# Altium schematic sheet Teensy_4.1_Section(B).SchDoc
size 420 x 297 mm; SheetNumber: 4; SheetTotal: 5
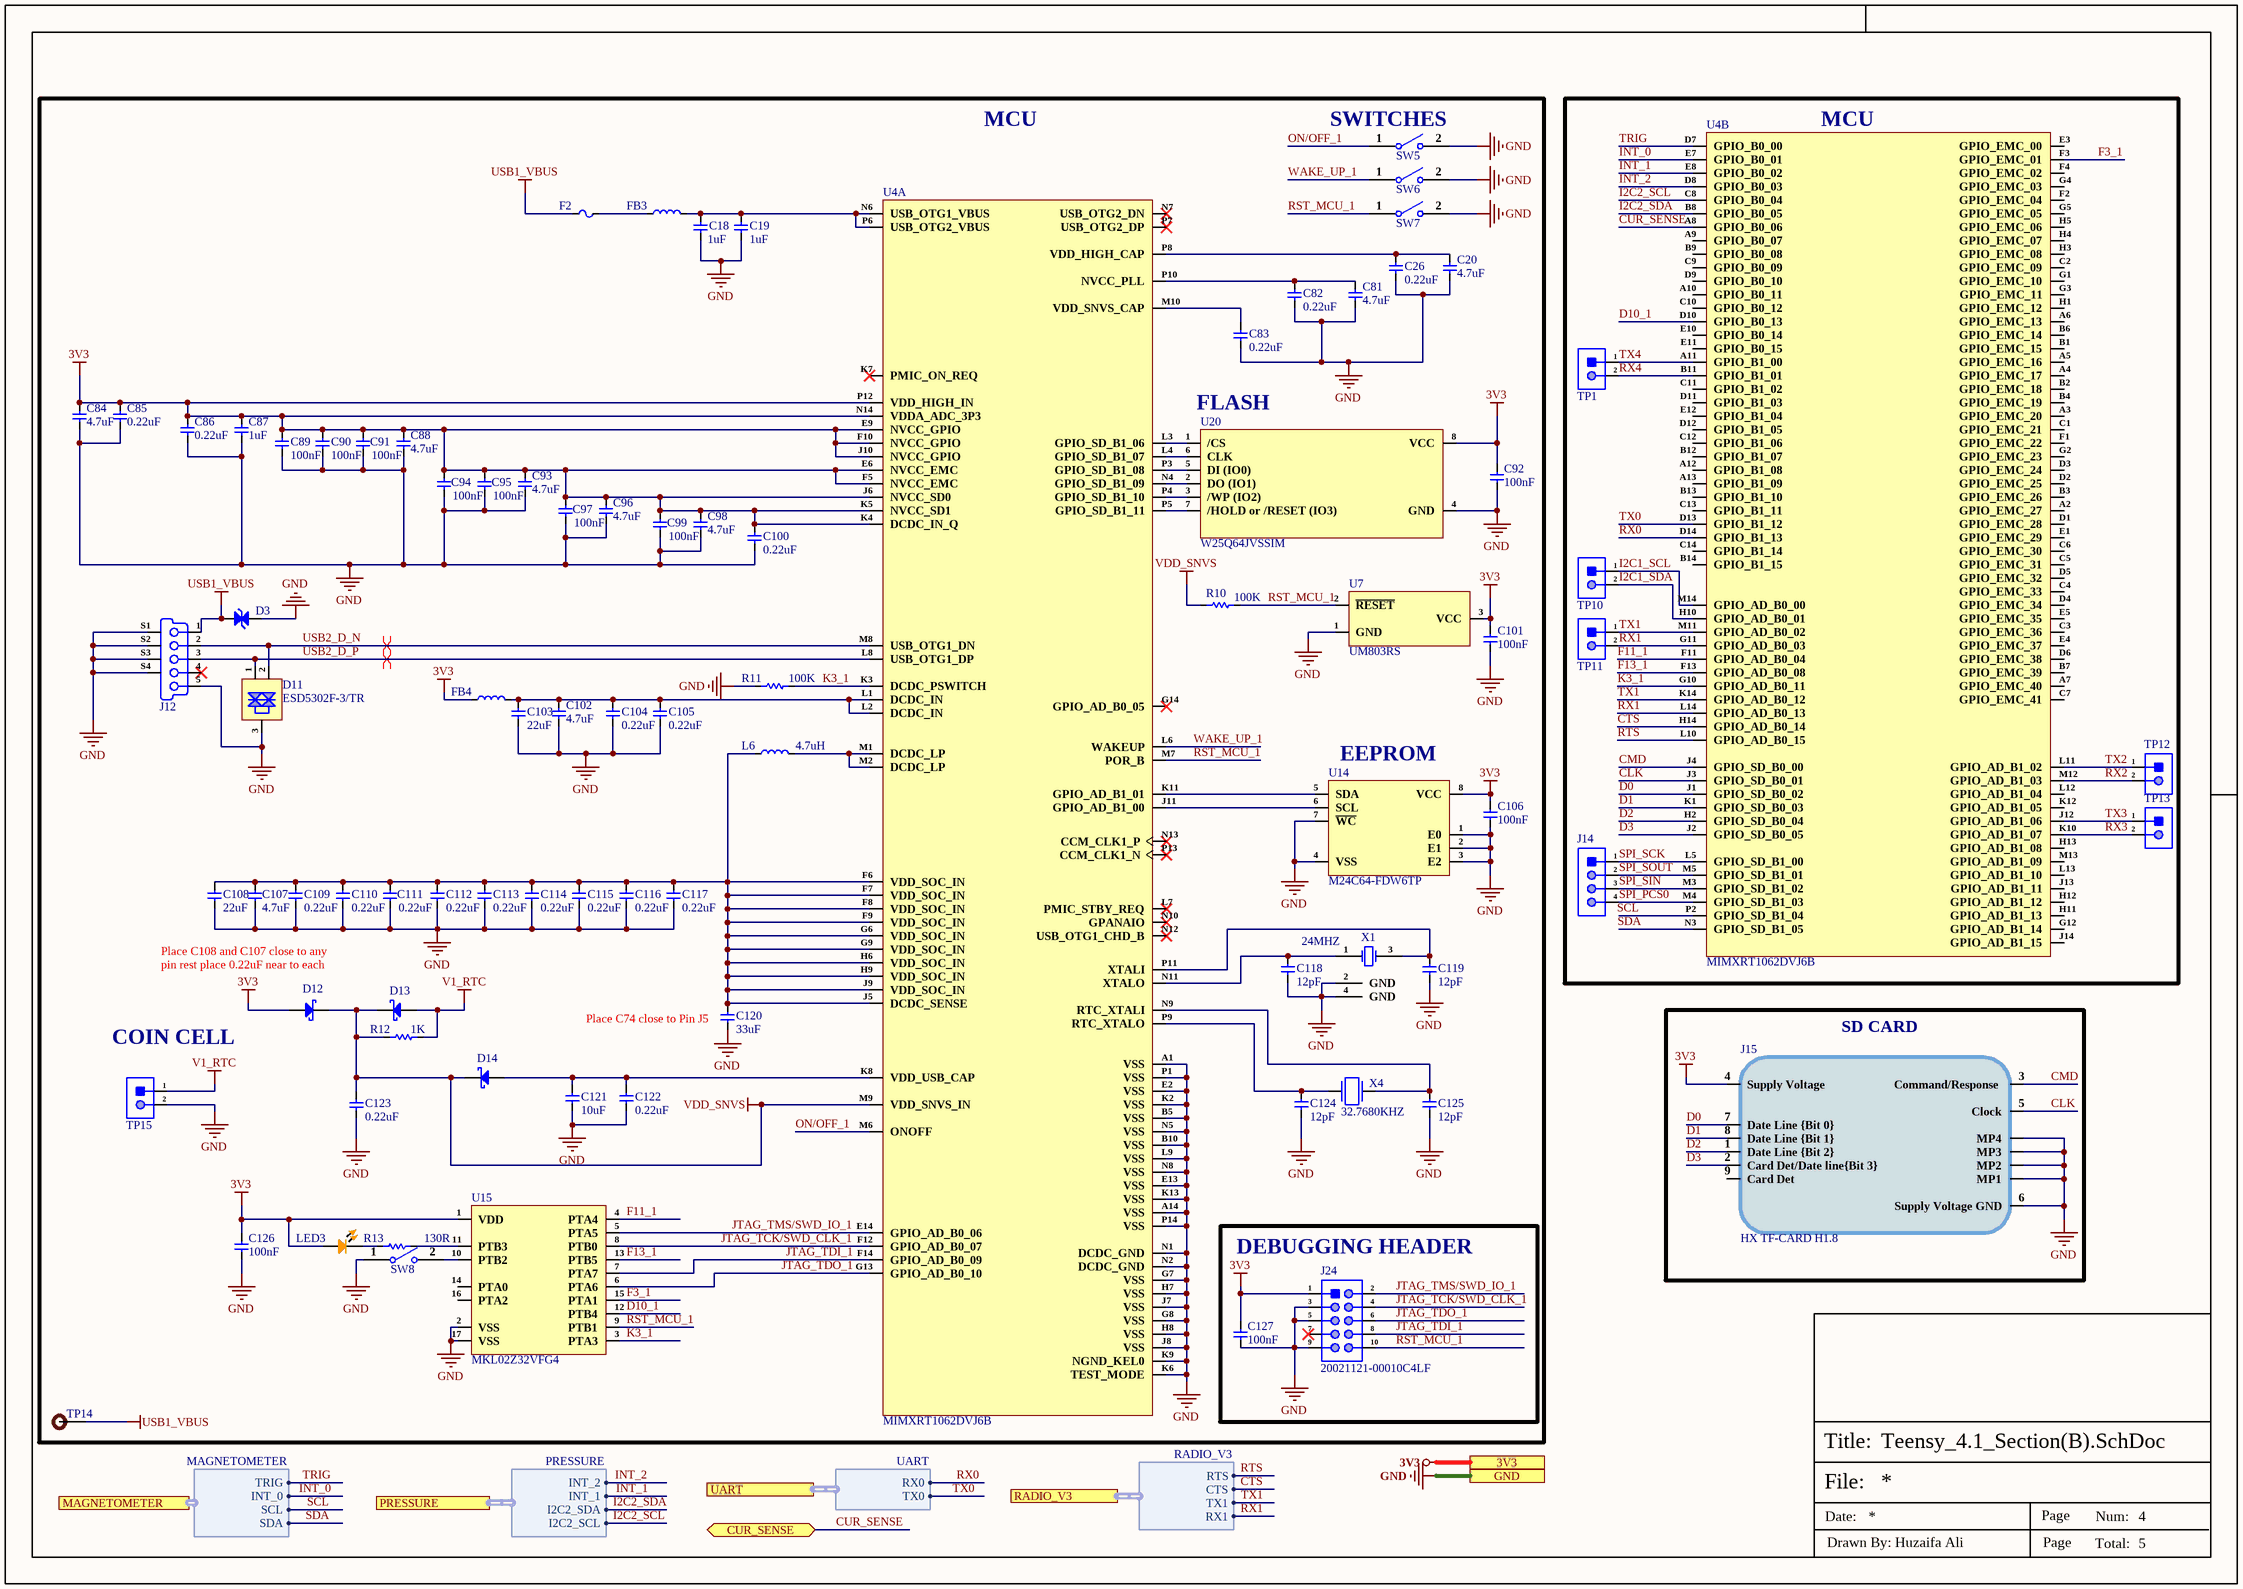
[diagram p0: Teensy_4.1_Section(B).SchDoc]

## Parts
C18  1uF  [Cap-0402]
C19  1uF  [Cap-0402]
C20  4.7uF  [Cap-0402]
C26  0.22uF  [Cap-0402]
C81  4.7uF  [Cap-0402]
C82  0.22uF  [Cap-0402]
C83  0.22uF  [Cap-0402]
C84  4.7uF  [Cap-0402]
C85  0.22uF  [Cap-0402]
C86  0.22uF  [Cap-0402]
C87  1uF  [Cap-0402]
C88  4.7uF  [Cap-0402]
C89  100nF  [cap-0402]
C90  100nF  [cap-0402]
C91  100nF  [cap-0402]
C92  100nF  [cap-0402]
C93  4.7uF  [Cap-0402]
C94  100nF  [cap-0402]
C95  100nF  [cap-0402]
C96  4.7uF  [Cap-0402]
C97  100nF  [cap-0402]
C98  4.7uF  [Cap-0402]
C99  100nF  [cap-0402]
C100  0.22uF  [Cap-0402]
C101  100nF  [cap-0402]
C102  4.7uF  [Cap-0402]
C103  22uF  [Cap-0603]
C104  0.22uF  [Cap-0402]
C105  0.22uF  [Cap-0402]
C106  100nF  [cap-0402]
C107  4.7uF  [Cap-0402]
C108  22uF  [Cap-0603]
C109  0.22uF  [Cap-0402]
C110  0.22uF  [Cap-0402]
C111  0.22uF  [Cap-0402]
C112  0.22uF  [Cap-0402]
C113  0.22uF  [Cap-0402]
C114  0.22uF  [Cap-0402]
C115  0.22uF  [Cap-0402]
C116  0.22uF  [Cap-0402]
C117  0.22uF  [Cap-0402]
C118  12pF  [Cap-0402]
C119  12pF  [Cap-0402]
C120  33uF  [Cap-1206]
C121  10uF  [Cap-0603]
C122  0.22uF  [Cap-0402]
C123  0.22uF  [Cap-0402]
C124  12pF  [Cap-0402]
C125  12pF  [Cap-0402]
C126  100nF  [cap-0402]
C127  100nF  [cap-0402]
D3  PESD5V0H1BSFYL  [DSN0603-2]  (value not drawn)
D11  ESD5302F-3/TR  [Sot-23]
D12  RB521S30T1G  [SOD-523]  (value not drawn)
D13  RB521S30T1G  [SOD-523]  (value not drawn)
D14  RB521S30T1G  [SOD-523]  (value not drawn)
F2  SMD0603-050  [Fuse-0603]  (value not drawn)
FB3  BLM15PD121SN1D  [IND-0402]  (value not drawn)
FB4  BLM15PD121SN1D  [IND-0402]  (value not drawn)
J12  HX MICRO XNJ JB  [HX MICRO XNJ JB]  (value not drawn)
J14  4 Pin SMD Wire Connector  [4 Pin SMD Wire CON.]  (value not drawn)  (no BOM)
J15  HX TF-CARD H1.8  [HX TF-CARD H1.8]
J24  20021121-00010C4LF  [20021121-00010C4LF_]
L6  4.7uH  [IND-1210]
LED3  Orange  [LED-0805]  (value not drawn)
R10  100K  [Res-0402]
R11  100K  [Res-0402]
R12  1K  [Res-0603]
R13  130R  [Res-0603]
SW5  B3U-1000P  [B3U-1000P]  (value not drawn)
SW6  B3U-1000P  [B3U-1000P]  (value not drawn)
SW7  B3U-1000P  [B3U-1000P]  (value not drawn)
SW8  B3U-1000P  [B3U-1000P]  (value not drawn)
TP1  2 Test Pad  [2 Test Pad]  (value not drawn)  (no BOM)
TP10  2 Test Pad  [2 Test Pad]  (value not drawn)  (no BOM)
TP11  2 Test Pad  [2 Test Pad]  (value not drawn)  (no BOM)
TP12  2 Test Pad  [2 Test Pad]  (value not drawn)  (no BOM)
TP13  2 Test Pad  [2 Test Pad]  (value not drawn)  (no BOM)
TP14  TEST POINT  [Test-point]  (value not drawn)  (no BOM)
TP15  2 Test Pad  [2 Test Pad]  (value not drawn)  (no BOM)
U4  MIMXRT1062DVJ6B  [196-LFBGA (12x12)]  (parts A,B of 2)
U7  UM803RS  [SOT-23]
U14  M24C64-FDW6TP  [8-TSSOP]
U15  MKL02Z32VFG4  [16-QFN (3x3).]
U20  W25Q64JVSSIM  [SOIC-8 (208 mil)]
X1  24MHZ  [X322524MOB4SI-]
X4  32.7680KHZ  [NX3215SA-32.768K-STD-MUA-8_]

## Blocks framed on the sheet
MCU: J14 TP1 TP10-TP13 U4
SD CARD: J15
DEBUGGING HEADER: C127 J24

## Ports
3V3 (see Top_Section[3B], Power_Section[1D], Sensor_Section[1D], Teensy_4.1_Section[5D]), CUR_SENSE (bidir, see Top_Section[4B], Sensor_Section[4D]), GND (see Top_Section[4C], Power_Section[1D], Sensor_Section[1D], Teensy_4.1_Section[5D]), MAGNETOMETER (harness MAGNETOMETER, see Top_Section[4C], Sensor_Section[2D]), PRESSURE (harness PRESSURE, see Top_Section[4C], Sensor_Section[2D]), RADIO_V3 (harness RADIO_V3, see Top_Section[4C], Sensor_Section[3D]), UART (harness UART, see Top_Section[3C], Teensy_4.1_Section[3D])

## Harnesses
PRESSURE: INT_2, INT_1, I2C2_SDA, I2C2_SCL
MAGNETOMETER: TRIG, INT_0, SCL, SDA
UART: RX0, TX0
RADIO_V3: RTS, CTS, TX1, RX1

## Nets
3V3: C84.2 C85.2 C86.2 C87.2 C88.2 C89.2 C90.2 C91.2 C92.2 C93.2 C94.2 C95.2 C96.2 C97.2 C98.2 C99.2 C100.2 C101.2 C106.2 C126.2 C127.2 D12.1(A) FB4.1 J15.4(Supply_Voltage) J24.1 LED3.1 U4.E6(NVCC_EMC) U4.E9(NVCC_GPIO) U4.F5(NVCC_EMC) U4.F10(NVCC_GPIO) U4.J6(NVCC_SD0) U4.J10(NVCC_GPIO) U4.K4(DCDC_IN_Q) U4.K5(NVCC_SD1) U4.N14(VDDA_ADC_3P3) U4.P12(VDD_HIGH_IN) U7.3(VCC) U14.8(VCC) U15.1(VDD) U20.8(VCC) ; port 3V3
GND: C18.1 C19.1 C20.1 C26.1 C81.1 C82.1 C83.1 C84.1 C85.1 C86.1 C87.1 C88.1 C89.1 C90.1 C91.1 C92.1 C93.1 C94.1 C95.1 C96.1 C97.1 C98.1 C99.1 C100.1 C101.1 C102.1 C103.1 C104.1 C105.1 C106.1 C107.1 C108.1 C109.1 C110.1 C111.1 C112.1 C113.1 C114.1 C115.1 C116.1 C117.1 C118.2 C119.2 C120.1 C121.1 C122.1 C123.1 C124.2 C125.2 C126.1 C127.1 D3.1(A) D11.3(GND) J12.5(GND) J12.S1(Shield) J12.S2(Shield) J12.S3(Shield) J12.S4(Shield) J15.6(Supply_Voltage_GND) J15.MP1 J15.MP2 J15.MP3 J15.MP4 J24.3 J24.5 J24.9 R11.1 SW5.2 SW6.2 SW7.2 SW8.1 TP15.2 U4.A1(VSS) U4.A14(VSS) U4.B5(VSS) U4.B10(VSS) U4.E2(VSS) U4.E13(VSS) U4.G7(VSS) U4.G8(VSS) U4.H7(VSS) U4.H8(VSS) U4.J7(VSS) U4.J8(VSS) U4.K2(VSS) U4.K6(TEST_MODE) U4.K9(NGND_KEL0) U4.K13(VSS) U4.L9(VSS) U4.N1(DCDC_GND) U4.N2(DCDC_GND) U4.N5(VSS) U4.N8(VSS) U4.P1(VSS) U4.P14(VSS) U7.1(GND) U14.1(E0) U14.2(E1) U14.3(E2) U14.4(VSS) U14.7(~{WC}) U15.2(VSS) U15.17(VSS) U20.4(GND) X1.2(GND) X1.4(GND) ; port GND
USB1_VBUS: D3.2(A) F2.1 J12.1(V_BUS_(5V)) TP14.1
V1_RTC: D13.1(A) R12.1 TP15.1
VDD_SNVS: C123.2 D12.2(K) D13.2(K) D14.2(K) R10.1 R12.2 U4.M9(VDD_SNVS_IN)
CLK: J15.5(Clock) U4.J3(GPIO_SD_B0_01)
CMD: J15.3(Command/Response) U4.J4(GPIO_SD_B0_00)
CTS: U4.H14(GPIO_AD_B0_14) ; port RADIO_V3.CTS
CUR_SENSE: U4.A8(GPIO_B0_06) ; port CUR_SENSE
D0: J15.7(Date_Line_{Bit_0}) U4.J1(GPIO_SD_B0_02)
D1: J15.8(Date_Line_{Bit_1}) U4.K1(GPIO_SD_B0_03)
D2: J15.1(Date_Line_{Bit_2}) U4.H2(GPIO_SD_B0_04)
D3: J15.2(Card_Det/Date_line{Bit_3}) U4.J2(GPIO_SD_B0_05)
D10_1: U4.D10(GPIO_B0_13) U15.12(PTB4)
F3_1: U4.F3(GPIO_EMC_01) U15.15(PTA1)
F11_1: U4.F11(GPIO_AD_B0_04) U15.4(PTA4)
F13_1: U4.F13(GPIO_AD_B0_08) U15.13(PTB5)
I2C1_SCL: TP10.1 U4.M14(GPIO_AD_B0_00)
I2C1_SDA: TP10.2 U4.H10(GPIO_AD_B0_01)
I2C2_SCL: U4.C8(GPIO_B0_04) ; port PRESSURE.I2C2_SCL
I2C2_SDA: U4.B8(GPIO_B0_05) ; port PRESSURE.I2C2_SDA
INT_0: U4.E7(GPIO_B0_01) ; port MAGNETOMETER.INT_0
INT_1: U4.E8(GPIO_B0_02) ; port PRESSURE.INT_1
INT_2: U4.D8(GPIO_B0_03) ; port PRESSURE.INT_2
JTAG_TCK/SWD_CLK_1: J24.4 U4.F12(GPIO_AD_B0_07) U15.8(PTB0)
JTAG_TDI_1: J24.8 U4.F14(GPIO_AD_B0_09) U15.7(PTA7)
JTAG_TDO_1: J24.6 U4.G13(GPIO_AD_B0_10) U15.6(PTA6)
JTAG_TMS/SWD_IO_1: J24.2 U4.E14(GPIO_AD_B0_06) U15.5(PTA5)
K3_1: R11.2 U4.G10(GPIO_AD_B0_11) U4.K3(DCDC_PSWITCH) U15.3(PTA3)
ON/OFF_1: SW5.1 U4.M6(ONOFF)
RST_MCU_1: J24.10 R10.2 SW7.1 U4.M7(POR_B) U7.2(~{RESET}) U15.9(PTB1)
RTS: U4.L10(GPIO_AD_B0_15) ; port RADIO_V3.RTS
RX0: U4.D14(GPIO_B1_13) ; port UART.RX0
RX1: TP11.2 U4.G11(GPIO_AD_B0_03) U4.L14(GPIO_AD_B0_13) ; port RADIO_V3.RX1
RX2: TP12.2 U4.M12(GPIO_AD_B1_03)
RX3: TP13.2 U4.K10(GPIO_AD_B1_07)
RX4: TP1.2 U4.B11(GPIO_B1_01)
SCL: U4.P2(GPIO_SD_B1_04) ; port MAGNETOMETER.SCL
SDA: U4.N3(GPIO_SD_B1_05) ; port MAGNETOMETER.SDA
SPI_PCS0: J14.4 U4.M4(GPIO_SD_B1_03)
SPI_SCK: J14.1 U4.L5(GPIO_SD_B1_00)
SPI_SIN: J14.3 U4.M3(GPIO_SD_B1_02)
SPI_SOUT: J14.2 U4.M5(GPIO_SD_B1_01)
TRIG: U4.D7(GPIO_B0_00) ; port MAGNETOMETER.TRIG
TX0: U4.D13(GPIO_B1_12) ; port UART.TX0
TX1: TP11.1 U4.K14(GPIO_AD_B0_12) U4.M11(GPIO_AD_B0_02) ; port RADIO_V3.TX1
TX2: TP12.1 U4.L11(GPIO_AD_B1_02)
TX3: TP13.1 U4.J12(GPIO_AD_B1_06)
TX4: TP1.1 U4.A11(GPIO_B1_00)
USB2_D_N: D11.2(I/O2) J12.2(D-) U4.M8(USB_OTG1_DN)
USB2_D_P: D11.1(I/O1) J12.3(D+) U4.L8(USB_OTG1_DP)
WAKE_UP_1: SW6.1 U4.L6(WAKEUP)
NetC18_2: C18.2 C19.2 FB3.2 U4.N6(USB_OTG1_VBUS) U4.P6(USB_OTG2_VBUS)
NetC20_2: C20.2 C26.2 U4.P8(VDD_HIGH_CAP)
NetC81_2: C81.2 C82.2 U4.P10(NVCC_PLL)
NetC83_2: C83.2 U4.M10(VDD_SNVS_CAP)
NetC102_2: C102.2 C103.2 C104.2 C105.2 FB4.2 U4.L1(DCDC_IN) U4.L2(DCDC_IN)
NetC107_2: C107.2 C108.2 C109.2 C110.2 C111.2 C112.2 C113.2 C114.2 C115.2 C116.2 C117.2 C120.2 L6.1 U4.F6(VDD_SOC_IN) U4.F7(VDD_SOC_IN) U4.F8(VDD_SOC_IN) U4.F9(VDD_SOC_IN) U4.G6(VDD_SOC_IN) U4.G9(VDD_SOC_IN) U4.H6(VDD_SOC_IN) U4.H9(VDD_SOC_IN) U4.J5(DCDC_SENSE) U4.J9(VDD_SOC_IN)
NetC118_1: C118.1 U4.N11(XTALO) X1.1(CRYSTAL)
NetC119_1: C119.1 U4.P11(XTALI) X1.3(CRYSTAL)
NetC121_2: C121.2 C122.2 D14.1(A) U4.K8(VDD_USB_CAP)
NetC124_1: C124.1 U4.P9(RTC_XTALO) X4.2
NetC125_1: C125.1 U4.N9(RTC_XTALI) X4.1
NetF2_2: F2.2 FB3.1
NetL6_2: L6.2 U4.M1(DCDC_LP) U4.M2(DCDC_LP)
NetLED3_2: LED3.2 R13.2
NetR13_1: R13.1 U15.11(PTB3)
NetSW8_2: SW8.2 U15.10(PTB2)
NetU4_J11: U4.J11(GPIO_AD_B1_00) U14.6(SCL)
NetU4_K11: U4.K11(GPIO_AD_B1_01) U14.5(SDA)
NetU4_L3: U4.L3(GPIO_SD_B1_06) U20.1(/CS)
NetU4_L4: U4.L4(GPIO_SD_B1_07) U20.6(CLK)
NetU4_N4: U4.N4(GPIO_SD_B1_09) U20.2(DO_(IO1))
NetU4_P3: U4.P3(GPIO_SD_B1_08) U20.5(DI_(IO0))
NetU4_P4: U4.P4(GPIO_SD_B1_10) U20.3(/WP_(IO2))
NetU4_P5: U4.P5(GPIO_SD_B1_11) U20.7(/HOLD_or_/RESET_(IO3))

Not connected (* = marked no-connect by the designer): J12 4(ID)*; J15 9(Card_Det); J24 7*; U4 A2(GPIO_EMC_27) A3(GPIO_EMC_20) A4(GPIO_EMC_17) A5(GPIO_EMC_16) A6(GPIO_EMC_13) A7(GPIO_EMC_40) A9(GPIO_B0_07) A10(GPIO_B0_11) A12(GPIO_B1_08) A13(GPIO_B1_09) B1(GPIO_EMC_15) B2(GPIO_EMC_18) B3(GPIO_EMC_26) B4(GPIO_EMC_19) B6(GPIO_EMC_14) B7(GPIO_EMC_39) B9(GPIO_B0_08) B12(GPIO_B1_07) B13(GPIO_B1_10) B14(GPIO_B1_15) C1(GPIO_EMC_21) C2(GPIO_EMC_09) C3(GPIO_EMC_36) C4(GPIO_EMC_33) C5(GPIO_EMC_31) C6(GPIO_EMC_30) C7(GPIO_EMC_41) C9(GPIO_B0_09) C10(GPIO_B0_12) C11(GPIO_B1_02) C12(GPIO_B1_06) C13(GPIO_B1_11) C14(GPIO_B1_14) D1(GPIO_EMC_28) D2(GPIO_EMC_25) D3(GPIO_EMC_24) D4(GPIO_EMC_34) D5(GPIO_EMC_32) D6(GPIO_EMC_38) D9(GPIO_B0_10) D11(GPIO_B1_03) D12(GPIO_B1_05) E1(GPIO_EMC_29) E3(GPIO_EMC_00) E4(GPIO_EMC_37) E5(GPIO_EMC_35) E10(GPIO_B0_14) E11(GPIO_B0_15) E12(GPIO_B1_04) F1(GPIO_EMC_22) F2(GPIO_EMC_04) F4(GPIO_EMC_02) G1(GPIO_EMC_10) G2(GPIO_EMC_23) G3(GPIO_EMC_11) G4(GPIO_EMC_03) G5(GPIO_EMC_05) G12(GPIO_AD_B1_14) G14(GPIO_AD_B0_05)* H1(GPIO_EMC_12) H3(GPIO_EMC_08) H4(GPIO_EMC_07) H5(GPIO_EMC_06) H11(GPIO_AD_B1_13) H12(GPIO_AD_B1_12) H13(GPIO_AD_B1_08) J13(GPIO_AD_B1_11) J14(GPIO_AD_B1_15) K7(PMIC_ON_REQ)* K12(GPIO_AD_B1_05) L7(PMIC_STBY_REQ)* L12(GPIO_AD_B1_04) L13(GPIO_AD_B1_10) M13(GPIO_AD_B1_09) N7(USB_OTG2_DN)* N10(GPANAIO)* N12(USB_OTG1_CHD_B)* N13(CCM_CLK1_P)* P7(USB_OTG2_DP)* P13(CCM_CLK1_N)*; U15 14(PTA0) 16(PTA2)

## Layout directives
differential pair; net class USB_PROGRAM; differential pair class USB_PROGRAM_Lines; rule Impedance Constraint [Min = 85.00    Max = 90.00    ]; rule Matched Net Lengths [Tolerance = 50mil]: USB2_D_N, USB2_D_P

## Notes on the sheet
- MCU
- (near SW5) SWITCHES
- (near U20) FLASH
- (near U14) EEPROM
- Place C108 and C107 close to any pin rest place 0.22uF near to each pin.
- (near TP15) COIN CELL
- (near C120) Place C74 close to Pin J5
- File:
- Title:
- Date:
- Page
- Num:
- Total:
- Drawn By: Huzaifa Ali

## Library data of the parts
C18 C19 C87 = CC0402KRX5R7BB105: CAP CER 1UF 16V X5R 0402; Manufacturer: Yageo; Tolerance: 10%; Item Type: Capacitor; Supplier 1: Digi-Key; Manufacturer Part Number: CC0402KRX5R7BB105; Stock 1: 1405667; Pricing 1: 1=0.36, 10=0.252, 100=0.1512, 500=0.1134, 1000=0.09576, 2500=0.09072, 5000=0.08568 (USD); Mount: Surface Mount; Case/Package: 0402; Weight: 2.3E-05oz; Case Code (Imperial): 0402; Case Code (Metric): 1005; Min Operating Temperature: -55°C; Max Operating Temperature: 85°C; Capacitance: 1uF; Dielectric: X5R; Packaging: Tape and Reel; Voltage Rating (DC): 16V; Voltage Rating: 16V; Termination: SMD/SMT; Composition: Ceramic; Length: 1mm; Height: 0.5mm; Width: 0.02inch; Thickness: 0.022inch; Depth: 0.5mm; Radiation Hardening: No; Lead Free: Lead Free; Halogen Free: Halogen Free; ComponentLink1URL: http://www.yageo.com/documents/recent/UPY-GPHC_X5R_4V-to-50V_12.pdf?src-supplier=Avnet+Europe; ComponentLink1Description: http://www.yageo.com/documents/recent/UPY-GPHC_X5R_4V-to-50V_12.pdf?src-supplier=Avnet+Europe; Supplier Part Number 1: 311-1691-6-ND; LCSC Part Number: C325464
C20 C81 C84 C88 C93 C96 C98 C102 C107 = CGA0402X5R475M250GT: 25V 4.7uF X5R ±20% 0402 Multilayer Ceramic Capacitors MLCC - SMD/SMT ROHS; Manufacturer: HRE; ComponentLink1Description: LCSC; ComponentLink1URL: https://www.lcsc.com/product-detail/Multilayer-Ceramic-Capacitors-MLCC-SMD-SMT_HRE-CGA0402X5R475M250GT_C6119795.html; Manufacturer Part Number: CGA0402X5R475M250GT; Footprint: 0402; Value: 4.7uF; LCSC Part Number: C6119795; Item Type: Capacitor
C26 C82 C83 C85 C86 C100 C104 C105 C109-C117 C122 C123 = CC0402KRX5R8BB224: CAP CER 0.22UF 25V X5R 0402; Manufacturer: Yageo; Capacitance: 220nF; Tolerance: 10%; Supplier 1: Mouser; Manufacturer Part Number: CC0402KRX5R8BB224; RoHS: Yes; Category: Ceramic Capacitors; Stock 1: 61266; Pricing 1: 1=0.10000, 10=0.03300, 50=0.03300, 100=0.02700, 1000=0.01500, 10000=0.01300 (USD); Mount: Surface Mount; Case/Package: 0402; Min Operating Temperature: -55°C; Max Operating Temperature: 85°C; Packaging: Tape and Reel; Voltage Rating: 25V; Voltage Rating (DC): 25V; Dielectric: X5R; Length: 0.039inch; Width: 0.02inch; Thickness: 0.022inch; Lead Free: Lead Free; Halogen Free: Halogen Free; RoHS Compliant: Yes; ComponentLink1URL: http://www.yageo.com/documents/recent/UPY-GPHC_X5R_4V-to-50V_25.pdf?src-supplier=Digi-Key; ComponentLink1Description: http://www.yageo.com/documents/recent/UPY-GPHC_X5R_4V-to-50V_25.pdf?src-supplier=Digi-Key; ComponentLink2URL: https://www.yageo.com/upload/media/product/productsearch/datasheet/mlcc/UPY-GPHC_X5R_4V-to-50V_26.pdf?src-supplier=Digi-Key; ComponentLink2Description: https://www.yageo.com/upload/media/product/productsearch/datasheet/mlcc/UPY-GPHC_X5R_4V-to-50V_26.pdf?src-supplier=Digi-Key; ComponentLink3URL: http://www.yageo.com/documents/recent/UPY-GPHC_X5R_4V-to-50V_23.pdf?src-supplier=Digi-Key; ComponentLink3Description: http://www.yageo.com/documents/recent/UPY-GPHC_X5R_4V-to-50V_23.pdf?src-supplier=Digi-Key; Supplier Part Number 1: 603-CC402KRX5R8BB224; LCSC Part Number: C326836
C89-C92 C94 C95 C97 C99 C101 C106 C126 C127 = C1005X7R1H104KT000F: CAP CER 0.1UF 50V X7R 0402; Manufacturer: TDK; Tolerance: 10%; Voltage: 25V; Item Type: Capacitor; Supplier 1: Avnet; Manufacturer Part Number: C1005X7R1H104KT000F; RoHS: No; Category: Ceramic Capacitors; Dielectric: X7R; Supplier Part Number 1: C1005X7R1H104KT000F; LCSC Part Number: C361198; ComponentLink1Description: LCSC; ComponentLink1URL: https://www.lcsc.com/product-detail/Multilayer-Ceramic-Capacitors-MLCC-SMD-SMT_TDK-C1005X7R1H104KT000F_C361198.html
C103 C108 = CC0603MRX5R6BB226: CAP CER 22UF 10V X5R 0603; Manufacturer: Yageo; Tolerance: 20%; Item Type: Capacitor; Supplier 1: Digi-Key; Manufacturer Part Number: CC0603MRX5R6BB226; RoHS: Yes; Category: Ceramic Capacitors; Stock 1: 19628; Pricing 1: 1=0.68000, 10=0.48000, 50=0.36300, 100=0.31610, 500=0.23416, 1000=0.19903 (USD); Mount: Surface Mount; Case/Package: 0603; Case Code (Metric): 1608; Case Code (Imperial): 0603; Weight: 7.1E-05oz; Min Operating Temperature: -55°C; Max Operating Temperature: 85°C; Packaging: Tape and Reel; Capacitance: 22uF; Voltage Rating: 10V; Dielectric: X5R; Termination: SMD/SMT; Voltage Rating (DC): 10V; Package Quantity: 4000; Length: 0.063inch; Width: 0.8mm; Height: 0.8mm; Thickness: 0.035inch; Lead Free: Lead Free; Halogen Free: Halogen Free; RoHS Compliant: Yes; ComponentLink1URL: http://www.mouser.com/ds/2/447/Yageo_UPY-GP_NP0_16V-to-50V_9-358835.pdf?src-supplier=Mouser; ComponentLink1Description: http://www.mouser.com/ds/2/447/Yageo_UPY-GP_NP0_16V-to-50V_9-358835.pdf?src-supplier=Mouser; ComponentLink2URL: http://www.yageo.com/documents/recent/UPY-GPHC_X5R_4V-to-50V_25.pdf?src-supplier=Digi-Key; ComponentLink2Description: http://www.yageo.com/documents/recent/UPY-GPHC_X5R_4V-to-50V_25.pdf?src-supplier=Digi-Key; Supplier Part Number 1: 311-1819-1-ND; LCSC Part Number: C109447
C118 C119 C124 C125 = GJM1555C1H120GB01D: CAP CER 12PF 50V C0G/NP0 0402; Manufacturer: Murata; Tolerance: 2%; Dielectric: C0G; Supplier 1: Digi-Key; Manufacturer Part Number: GJM1555C1H120GB01D; RoHS: Yes; Category: Ceramic Capacitors; Stock 1: 266975; Pricing 1: 1=0.18000, 10=0.12600, 50=0.07560, 100=0.06390, 500=0.04370, 1000=0.03865, 2500=0.03698, 5000=0.03361 (USD); Mount: Surface Mount; Case/Package: 0402; Case Code (Imperial): 0402; Case Code (Metric): 1005; Min Operating Temperature: -55°C; Max Operating Temperature: 125°C; Capacitance: 12pF; Voltage Rating: 50V; Voltage Rating (DC): 50V; Packaging: Tape and Reel; Package Quantity: 10000; Termination: SMD/SMT; Series: GJM; Construction: Flat; Length: 1mm; Width: 0.5mm; Height: 0.5mm; Thickness: 0.022inch; Depth: 0.5mm; Radiation Hardening: No; Lead Free: Lead Free; RoHS Compliant: Yes; ComponentLink1URL: https://datasheet.ciiva.com/11608/product-11608208.pdf?src-supplier=Avnet; ComponentLink1Description: https://datasheet.ciiva.com/11608/product-11608208.pdf?src-supplier=Avnet; ComponentLink2URL: https://datasheet.ciiva.com/29542/partnumbering-e-01-29542716.pdf?src-supplier=Digi-Key; ComponentLink2Description: https://datasheet.ciiva.com/29542/partnumbering-e-01-29542716.pdf?src-supplier=Digi-Key; ComponentLink3URL: https://datasheet.ciiva.com/29542/partnumbering-e-01-29542715.pdf?src-supplier=Digi-Key; ComponentLink3Description: https://datasheet.ciiva.com/29542/partnumbering-e-01-29542715.pdf?src-supplier=Digi-Key; ComponentLink4URL: https://datasheet.ciiva.com/29542/partnumbering-e-01-29542717.pdf?src-supplier=Digi-Key; ComponentLink4Description: https://datasheet.ciiva.com/29542/partnumbering-e-01-29542717.pdf?src-supplier=Digi-Key; Supplier Part Number 1: 490-8078-1-ND; LCSC Part Number: C161305
C120 = C3216X5R1A336MTJ00N: 10V 33uF X5R ±20% 1206 ROHS; Manufacturer: TDK; Item Type: Capacitor; ComponentLink1URL: https://datasheet.ciiva.com/24216/c3216x5r1a336m160ab-264972-24216176.pdf?src-supplier=Mouser; ComponentLink1Description: https://datasheet.ciiva.com/24216/c3216x5r1a336m160ab-264972-24216176.pdf?src-supplier=Mouser; ComponentLink2URL: https://datasheet.ciiva.com/16482/mlccspec-commercial-general-midvoltage-en-16482550.pdf?src-supplier=Future+Electronics; ComponentLink2Description: https://datasheet.ciiva.com/16482/mlccspec-commercial-general-midvoltage-en-16482550.pdf?src-supplier=Future+Electronics; ComponentLink3URL: https://datasheet.ciiva.com/6253/tdkmlcccaprange-6253132.pdf?src-supplier=Digi-Key; ComponentLink3Description: https://datasheet.ciiva.com/6253/tdkmlcccaprange-6253132.pdf?src-supplier=Digi-Key; ComponentLink4URL: https://datasheet.ciiva.com/6253/tdkmlcccaprange-6253134.pdf?src-supplier=Digi-Key; ComponentLink4Description: https://datasheet.ciiva.com/6253/tdkmlcccaprange-6253134.pdf?src-supplier=Digi-Key; LCSC Part Number: C342606; Manufacturer Part Number: C3216X5R1A336MTJ00N; Package: 1206
C121 = CL10A106MA8NRNC: CAP CER 10UF 25V X5R 0603; Manufacturer: Samsung; Tolerance: 20%; Supplier 1: Avnet; Manufacturer Part Number: CL10A106MA8NRNC; RoHS: Yes; Category: Ceramic Capacitors; Pricing 1: 4000=0.03753, 8000=0.03700, 16000=0.03595, 24000=0.03515, 32000=0.03383, 40000=0.03304, 400000=0.03225 (USD); Mount: Surface Mount; Case/Package: 0603; Case Code (Metric): 1608; Case Code (Imperial): 0603; Contact Plating: Tin; Min Operating Temperature: -55°C; Max Operating Temperature: 85°C; Package Quantity: 1; Packaging: Tape and Reel; Capacitance: 10uF; Voltage Rating: 25V; Dielectric: X5R; Termination: Wraparound; Series: CL; Construction: Flat; Length: 0.063inch; Width: 0.031inch; Thickness: 0.035inch; Lead Free: Lead Free; RoHS Compliant: Yes; ComponentLink1URL: https://datasheet.ciiva.com/25766/cl10a106ma8nrnc-25766562.pdf?src-supplier=Digi-Key; ComponentLink1Description: https://datasheet.ciiva.com/25766/cl10a106ma8nrnc-25766562.pdf?src-supplier=Digi-Key; Supplier Part Number 1: CL10A106MA8NRNC; LCSC Part Number: C96446
D3 = PESD5V0H1BSFYL: TVS DIODE 5VWM 6.3VC DSN0603-2; Manufacturer: Nexperia; Supplier 1: Avnet; Manufacturer Part Number: PESD5V0H1BSFYL; RoHS: Yes; Category: ESD and Circuit Protection ICs; Stock 1: 9000; Pricing 1: 18000=0.06453, 36000=0.06278, 54000=0.06104, 90000=0.05930, 180000=0.05755, 900000=0.05581, 1800000=0.05406 (USD); RoHS Compliant: Yes; ComponentLink1URL: http://www.farnell.com/datasheets/1961312.pdf?src-supplier=Farnell; ComponentLink1Description: http://www.farnell.com/datasheets/1961312.pdf?src-supplier=Farnell; ComponentLink2URL: https://assets.nexperia.com/documents/data-sheet/PESD5V0H1BSF.pdf?src-supplier=Digi-Key; ComponentLink2Description: https://assets.nexperia.com/documents/data-sheet/PESD5V0H1BSF.pdf?src-supplier=Digi-Key; ComponentLink3URL: http://www.farnell.com/datasheets/1961312.pdf?src-supplier=Newark; ComponentLink3Description: http://www.farnell.com/datasheets/1961312.pdf?src-supplier=Newark; Supplier Part Number 1: PESD5V0H1BSFYL; LCSC Part Number: C477989; Item Type: Diode
D11 = ESD5302F-3/TR: 16A 20V 7V 5V@Max Unidirectional SOT-23 TVS ROHS; Manufacturer: WILLSEMI; Item Type: Diode; Manufacturer Part Number: ESD5302F-3/TR; Package: SOT-23; LCSC Part Number: C239643; ComponentLink1Description: LCSC; ComponentLink1URL: https://www.lcsc.com/product-detail/TVS_WILLSEMI-Will-Semicon-ESD5302F-3-TR_C239643.html
D12-D14 = RB521S30T1G: DIODE SCHOTTKY 30V 200MA SOD523; Manufacturer: ON Semiconductor; Element Configuration: Single; Max Surge Current: 1A; Max Reverse Current: 30uA; Forward Voltage: 500mV; Power Dissipation: 200mW; Polarity: Standard; Supplier: Future Electronics; Supplier Part Number: 4067781; Manufacturer Part Number: RB521S30T1G; RoHS: Yes; Category: Rectifier Diodes; Stock: 156000; Pricing: 3000=0.0165, 12000=0.0158, 45000=0.0151, 90000=0.0148, 225000=0.0141 (USD); Case/Package: SOD-523-2; Pins: 2; Min Operating Temperature: -55°C; Max Operating Temperature: 125°C; Forward Current: 200mA; Max Repetitive Reverse Voltage (Vrrm): 30V; Package Quantity: 1; Packaging: Tape and Reel; Average Rectified Current: 200mA; Max Reverse Leakage Current: 30uA; Peak Non-Repetitive Surge Current: 1A; Max Forward Surge Current (Ifsm): 1A; Voltage Rating (DC): 30V; Current Rating: 200mA; Output Current: 200mA; Max Reverse Voltage (DC): 30V; Series: -; Length: 1.3mm; Width: 0.9mm; Height: 0.7mm; Radiation Hardening: No; RoHS Compliant: Yes; Reach SVHC Compliant: No; Lead Free: Lead Free; ComponentLink1URL: http://www.farnell.com/datasheets/2354099.pdf?src-supplier=Newark; ComponentLink1Description: http://www.farnell.com/datasheets/2354099.pdf?src-supplier=Newark; LCSC Part Number: C145179; Item Type: Diode
F2 = SMD0603-050: 6V 500mA 40A 1A 0603 Resettable Fuses ROHS; Manufacturer: TECHFUSE; Item Type: Fuse; Supplier 1: LCSC; Manufacturer Part Number: SMD0603-050; RoHS: No; Category: Uncategorized; Supplier Part Number 1: C69679; LCSC Part Number: C69679; ComponentLink1Description: LCSC; ComponentLink1URL: https://www.lcsc.com/product-detail/Resettable-Fuses_TECHFUSE-SMD0603-050_C69679.html
FB3 FB4 = BLM15PD121SN1D: FERRITE BEAD 120 OHM 0402 1LN; Manufacturer: Murata; Material: Steel,Ferrite; Tolerance: 25%; Impedance: 120R; Current Rating: 1.3A; Number of Lines: 1; DC Resistance (DCR): 90mR; Test Frequency: 100MHz; Supplier 1: Avnet; Manufacturer Part Number: BLM15PD121SN1D; RoHS: Yes; Category: Ferrite Beads and Chips; Stock 1: 300000; Pricing 1: 10000=0.03238, 20000=0.03063, 40000=0.02888, 60000=0.02713, 80000=0.02538, 100000=0.02363, 1000000=0.02188 (USD); Case/Package: 0402; Number of Pins: 2; Core Material: Ferrite; Case Code (Metric): 1005; Case Code (Imperial): 0402; Min Operating Temperature: -55°C; Max Operating Temperature: 125°C; Package Quantity: 1; Packaging: Tape and Reel; Max Current Rating: 1.3A; Termination: SMD/SMT; Max DC Current: 1.3A; DC Current: 1.3A; Number of Circuits: 1; Series: BLM15PD; DC Resistance-Max: 90mR; Length: 1mm; Width: 0.5mm; Height: 0.5mm; Depth: 0.55mm; Radiation Hardening: No; Reach SVHC Compliant: Yes; Military Standard: Not; Lead Free: Lead Free; RoHS Compliant: Yes; ComponentLink1URL: https://datasheet.ciiva.com/11800/0900766b811b5866-11800860.pdf?src-supplier=RSComponents; ComponentLink1Description: https://datasheet.ciiva.com/11800/0900766b811b5866-11800860.pdf?src-supplier=RSComponents; ComponentLink2URL: https://datasheet.ciiva.com/18093/getdatasheetpartid-195858-18093157.pdf?src-supplier=Verical; ComponentLink2Description: https://datasheet.ciiva.com/18093/getdatasheetpartid-195858-18093157.pdf?src-supplier=Verical; ComponentLink3URL: https://datasheet.ciiva.com/41425/001171686-da-01-en-chip-drossel0402-120r-1300ma-1-0x0-5mm-41425776.pdf?src-supplier=Conrad; ComponentLink3Description: https://datasheet.ciiva.com/41425/001171686-da-01-en-chip-drossel0402-120r-1300ma-1-0x0-5mm-41425776.pdf?src-supplier=Conrad; ComponentLink4URL: https://datasheet.ciiva.com/41449/001172205-da-01-en-drossel-0402-120r-11-0x0-5mm-10000st-41449495.pdf?src-supplier=Conrad; ComponentLink4Description: https://datasheet.ciiva.com/41449/001172205-da-01-en-drossel-0402-120r-11-0x0-5mm-10000st-41449495.pdf?src-supplier=Conrad; ComponentLink5URL: https://datasheet.ciiva.com/1012/l0110e-1012435.pdf?src-supplier=Digi-Key; ComponentLink5Description: https://datasheet.ciiva.com/1012/l0110e-1012435.pdf?src-supplier=Digi-Key; ComponentLink6URL: https://datasheet.ciiva.com/1012/l0110e-1012434.pdf?src-supplier=Digi-Key; ComponentLink6Description: https://datasheet.ciiva.com/1012/l0110e-1012434.pdf?src-supplier=Digi-Key; ComponentLink7URL: https://datasheet.ciiva.com/1012/l0110e-1012436.pdf?src-supplier=Digi-Key; ComponentLink7Description: https://datasheet.ciiva.com/1012/l0110e-1012436.pdf?src-supplier=Digi-Key; Supplier Part Number 1: BLM15PD121SN1D; LCSC Part Number: C76891; Item Type: Ferrite Bead
J12 = HX MICRO XNJ JB: Female Micro-B SMD USB Connectors ROHS; Manufacturer: HANXIA; Item Type: Micro-B Connector; Manufacturer Part Number: HX MICRO XNJ JB; Package: Custom; LCSC Part Number: C5160305; ComponentLink1Description: LCSC; ComponentLink1URL: https://www.lcsc.com/product-detail/USB-Connectors_hanxia-HX-MICRO-XNJ-JB_C5160305.html
J14 = 4 Pin SMD Wire Connector: Wire Connecting Pads; Item Type: SMD Pads; Manufacturer Part Number: 4 Pin SMD Wire Connector
J15 = HX TF-CARD H1.8: -40℃~+70℃ 1.8mm Gold Card Slot MicroSD card (TF card) Brass Alloy Self-bouncing SMD SD Card / Memory Card Connector ROHS; Manufacturer: hanxia; Card Connection Mode: Pluggable; Item Type: MicroSD; ComponentLink1Description: LCSC; ComponentLink1URL: https://www.lcsc.com/product-detail/SD-Card-Memory-Card-Connector_hanxia-HX-TF-CARD-H1-8_C19189036.html; Manufacturer Part Number: HX TF-CARD H1.8; LCSC Part Number: C19189036
J24 = 20021121-00010C4LF: CONN HEADER SMD 10POS 1.27MM; Manufacturer: Amphenol FCI; Number of Contacts: 10; Contact Resistance: 30mR; Current Rating: 1A; Voltage Rating: 125V; Insulation Resistance: 100MR; Gender: Male; Connector Type: Male Pin,Header; Row Spacing: 0.05inch; Stack Height: 3mm; Item Type: Jtag Male Header; Supplier 1: Digi-Key; Manufacturer Part Number: 20021121-00010C4LF; Stock 1: 0; Pricing 1: 1=0.87, 10=0.761, 100=0.6563 (USD); Mount: Surface Mount; Contact Plating: Gold; Contact Material: Copper Alloy,Copper,Gold; Color: Black; Housing Color: Black; Housing Material: Thermoplastic; Min Operating Temperature: -40°C; Max Operating Temperature: 85°C; Number of Rows: 2; Termination: Solder; Packaging: Tape and Reel; Package Quantity: 600; Number of Positions: 10; Max Voltage Rating (AC): 125V; Orientation: Straight; Length: 6.35mm; Pitch: 1.27mm; Contact Mating Length: 0.12inch; Depth: 3.4mm; Radiation Hardening: No; REACH SVHC: No SVHC; ComponentLink1URL: https://www.verical.com/server-webapp/html/getDatasheet?partID=177140&src-supplier=Verical; ComponentLink1Description: https://www.verical.com/server-webapp/html/getDatasheet?partID=177140&src-supplier=Verical; ComponentLink2URL: http://portal.fciconnect.com/Comergent/fci/drawing/20021121.pdf?src-supplier=Avnet; ComponentLink2Description: http://portal.fciconnect.com/Comergent/fci/drawing/20021121.pdf?src-supplier=Avnet; ComponentLink3URL: https://cdn.amphenol-icc.com/media/wysiwyg/files/drawing/20021121.pdf?src-supplier=Digi-Key; ComponentLink3Description: https://cdn.amphenol-icc.com/media/wysiwyg/files/drawing/20021121.pdf?src-supplier=Digi-Key; ComponentLink4URL: http://portal.fciconnect.com/Comergent/fci/drawing/20021121.pdf?src-supplier=Avnet+Europe; ComponentLink4Description: http://portal.fciconnect.com/Comergent/fci/drawing/20021121.pdf?src-supplier=Avnet+Europe; ComponentLink5URL: https://media.digikey.com/pdf/Data%20Sheets/FCI%20PDFs/Minitek%20127_Catalog.pdf?src-supplier=Digi-Key; ComponentLink5Description: https://media.digikey.com/pdf/Data%20Sheets/FCI%20PDFs/Minitek%20127_Catalog.pdf?src-supplier=Digi-Key; ComponentLink6URL: http://portal.fciconnect.com/Comergent//fci/drawing/20021121.pdf?src-supplier=Mouser; ComponentLink6Description: http://portal.fciconnect.com/Comergent//fci/drawing/20021121.pdf?src-supplier=Mouser; Supplier Part Number 1: 609-3695-6-ND; LCSC Part Number: C150517
L6 = DFE322512F-4R7M=P2: FIXED IND 4.7UH 1.6A 157MOHM SMD; Manufacturer: Murata; Item Type: Inductor; Supplier 1: Digi-Key; Manufacturer Part Number: DFE322512F-4R7M=P2; RoHS: Yes; Category: Fixed Inductors; Stock 1: 4687; Pricing 1: 1=0.61, 10=0.533, 25=0.4952, 50=0.4188, 100=0.3808, 250=0.35792, 500=0.31984, 1000=0.25892 (USD); RoHS Compliant: Yes; Supplier Part Number 1: 490-DFE322512F-4R7M=P2CT-ND; LCSC Part Number: C703083
LED3 = XL-2012UOC: Colorless transparence -30℃~+85℃ 601nm~603nm Positive post Orange 120° 55mW 0805 Light Emitting Diodes (LED) ROHS; Manufacturer: XINGLIGHT; Manufacture Part No: XL-2012UOC; Package: 0805; LCSC Part no: C965813
R10 R11 = RC0402FR-07100KL: RES 100K OHM 1% 1/16W 0402; Manufacturer: Yageo; Resistance: 100kR; Temperature Coefficient: 100ppm/°C; Power Rating: 63mW; Voltage Rating: 50V; Item Type: Resistor; Supplier 1: Mouser; Manufacturer Part Number: RC0402FR-07100KL; RoHS: Yes; Category: Chip SMD Resistors; Stock 1: 7759549; Pricing 1: 1=0.10000, 10=0.01200, 50=0.01200, 100=0.00500, 1000=0.00300, 2500=0.00200, 10000=0.00100 (USD); Case/Package: 0402; Case Code (Metric): 1005; Case Code (Imperial): 0402; Min Operating Temperature: -55°C; Max Operating Temperature: 155°C; Resistor Type: Thick Film; Tolerance: 1%; Packaging: Tape and Reel; Package Quantity: 1; Number of Terminations: 2; Termination: SMD/SMT; Max Power Dissipation: 63mW; Working Voltage: 50V; Features: Moisture Resistant; Series: RC; Resistance Tolerance: 1%; Construction: Rectangular; Technology: THICK FILM; Length: 0.039inch; Width: 0.02inch; Height: 0.016inch; Depth: 0.5mm; REACH SVHC: No SVHC; Lead Free: Lead Free; RoHS Compliant: Yes; Military Standard: Not; ComponentLink1URL: https://datasheet.ciiva.com/11819/0900766b80c66297-11819452.pdf?src-supplier=RSComponents; ComponentLink1Description: https://datasheet.ciiva.com/11819/0900766b80c66297-11819452.pdf?src-supplier=RSComponents; ComponentLink2URL: https://datasheet.ciiva.com/22747/1018594-22747509.pdf?src-supplier=Element14; ComponentLink2Description: https://datasheet.ciiva.com/22747/1018594-22747509.pdf?src-supplier=Element14; ComponentLink3URL: https://datasheet.ciiva.com/2453/pyu-r-int-thick-7-2453362.pdf?src-supplier=Digi-Key; ComponentLink3Description: https://datasheet.ciiva.com/2453/pyu-r-int-thick-7-2453362.pdf?src-supplier=Digi-Key; ComponentLink4URL: https://datasheet.ciiva.com/2453/pyu-r-int-thick-7-2453363.pdf?src-supplier=Digi-Key; ComponentLink4Description: https://datasheet.ciiva.com/2453/pyu-r-int-thick-7-2453363.pdf?src-supplier=Digi-Key; ComponentLink5URL: https://datasheet.ciiva.com/2453/pyu-r-int-thick-7-2453361.pdf?src-supplier=Digi-Key; ComponentLink5Description: https://datasheet.ciiva.com/2453/pyu-r-int-thick-7-2453361.pdf?src-supplier=Digi-Key; ComponentLink6URL: https://datasheet.ciiva.com/12667/pyu-rc0402-51-rohs-l-6-r-12667930.pdf?src-supplier=Mouser; ComponentLink6Description: https://datasheet.ciiva.com/12667/pyu-rc0402-51-rohs-l-6-r-12667930.pdf?src-supplier=Mouser; ComponentLink7URL: https://datasheet.ciiva.com/15189/getdatasheetpartid-323696-15189334.pdf?src-supplier=Verical; ComponentLink7Description: https://datasheet.ciiva.com/15189/getdatasheetpartid-323696-15189334.pdf?src-supplier=Verical; Supplier Part Number 1: 603-RC0402FR-07100KL; LCSC Part Number: C60491
R12 = RC0603FR-071KL: RES SMD 1K OHM 1% 1/10W 0603; Manufacturer: Yageo; Resistance: 1kR; Temperature Coefficient: 100ppm/°C; Power Rating: 100mW; Voltage Rating: 50V; Item type: Resistor; ComponentLink1URL: https://www.verical.com/server-webapp/html/getDatasheet?partID=409289&src-supplier=Verical; ComponentLink1Description: https://www.verical.com/server-webapp/html/getDatasheet?partID=409289&src-supplier=Verical; Supplier 1: Digi-Key; Manufacturer Part Number: RC0603FR-071KL; Stock 1: 21472395; Pricing 1: 1=0.1, 10=0.023, 100=0.0094, 1000=0.0042, 2500=0.0037 (USD); Case/Package: 0603; Contact Plating: Tin,Matte; Case Code (Imperial): 0603; Case Code (Metric): 1608; Min Operating Temperature: -55°C; Max Operating Temperature: 155°C; Tolerance: 1%; Composition: Thick Film; Packaging: Tape and Reel; Termination: SMD/SMT; Military Standard: Not; Length: 1.6mm; Height: 0.45mm; Depth: 0.8mm; Radiation Hardening: No; REACH SVHC: No SVHC; Lead Free: Lead Free; ComponentLink2URL: http://documents.rs-components.com/techlib://itc_doclist_GB.htm?stockno=5048928&src-supplier=RSComponents; ComponentLink2Description: http://documents.rs-components.com/techlib://itc_doclist_GB.htm?stockno=5048928&src-supplier=RSComponents; ComponentLink3URL: http://www.yageo.com/documents/recent/PYu-RC0603_51_RoHS_L_4.pdf?src-supplier=Avnet+Europe; ComponentLink3Description: http://www.yageo.com/documents/recent/PYu-RC0603_51_RoHS_L_4.pdf?src-supplier=Avnet+Europe; ComponentLink4URL: http://www.farnell.com/datasheets/2167052.pdf?src-supplier=Element14; ComponentLink4Description: http://www.farnell.com/datasheets/2167052.pdf?src-supplier=Element14; ComponentLink5URL: http://www.farnell.com/datasheets/1868787.pdf?src-supplier=Element14; ComponentLink5Description: http://www.farnell.com/datasheets/1868787.pdf?src-supplier=Element14; ComponentLink6URL: http://www.yageo.com/documents/recent/PYu-RC_Group_51_RoHS_L_2.pdf?src-supplier=Avnet; ComponentLink6Description: http://www.yageo.com/documents/recent/PYu-RC_Group_51_RoHS_L_2.pdf?src-supplier=Avnet; ComponentLink7URL: https://www.verical.com/server-webapp/html/getDatasheet?partID=404327&src-supplier=Verical; ComponentLink7Description: https://www.verical.com/server-webapp/html/getDatasheet?partID=404327&src-supplier=Verical; ComponentLink8URL: http://www.farnell.com/datasheets/443971.pdf?src-supplier=Element14; ComponentLink8Description: http://www.farnell.com/datasheets/443971.pdf?src-supplier=Element14; Supplier Part Number 1: 311-1.00KHRDKR-ND; LCSC Part Number: C22548
R13 = RC0603FR-07130RL: RES 130 OHM 1% 1/10W 0603; Manufacturer: Yageo; Power Rating: 100mW; Temperature Coefficient: 100ppm/°C; Voltage Rating (DC): 50V; Voltage Rating: 75V; Item Type: Resistor; Supplier 1: Future Electronics; Manufacturer Part Number: RC0603FR-07130RL; RoHS: Yes; Category: Chip SMD Resistors; Stock 1: 630000; Pricing 1: 5000=0.0014, 75000=0.0013, 200000=0.0013, 750000=0.0012, 2000000=0.0011 (USD); Case/Package: 0603; Pins: 2; Case Code (Imperial): 0603; Case Code (Metric): 1608; Weight: 7.1E-05oz; Min Operating Temperature: -55°C; Max Operating Temperature: 155°C; Value: 130R; Tolerance: 1%; Packaging: Tape and Reel; Resistor Type: Thick Film; Termination: SMD/SMT; Number of Terminations: 2; Max Power Dissipation: 100mW; Features: Moisture Resistant; Series: RC; Resistance Tolerance: 1%; Construction: Rectangular; Length: 1.6mm; Width: 0.8mm; Height: 0.45mm; Depth: 0.8mm; Lead Free: Lead Free; Reach SVHC Compliant: No; Military Standard: Not; RoHS Compliant: Yes; ComponentLink1URL: https://datasheet.ciiva.com/46395/443971-46395023.pdf?src-supplier=Element14; ComponentLink1Description: https://datasheet.ciiva.com/46395/443971-46395023.pdf?src-supplier=Element14; ComponentLink2URL: https://datasheet.ciiva.com/2553/pyu-r-int-thick-7-2553516.pdf?src-supplier=Digi-Key; ComponentLink2Description: https://datasheet.ciiva.com/2553/pyu-r-int-thick-7-2553516.pdf?src-supplier=Digi-Key; ComponentLink3URL: https://datasheet.ciiva.com/2553/pyu-r-int-thick-7-2553517.pdf?src-supplier=Digi-Key; ComponentLink3Description: https://datasheet.ciiva.com/2553/pyu-r-int-thick-7-2553517.pdf?src-supplier=Digi-Key; ComponentLink4URL: https://datasheet.ciiva.com/2553/pyu-r-int-thick-7-2553515.pdf?src-supplier=Digi-Key; ComponentLink4Description: https://datasheet.ciiva.com/2553/pyu-r-int-thick-7-2553515.pdf?src-supplier=Digi-Key; Supplier Part Number 1: 1846773; LCSC Part Number: C141677
SW5-SW8 = B3U-1000P: SWITCH TACTILE SPST-NO 0.05A 12V; Manufacturer: Omron; Mechanical Life: 200000Cycles; Operating Force: 1.5N; Throw Configuration: SPST; Current Rating: 50mA; Contact Resistance: 100mR; Illumination Type: Non-Illuminated,Illuminated; Switch Travel: 0.15mm; Switch Function: Off-Mom; Actuator Type: Standard; Actuator Length: 0.4mm; Ratings: Dust Proof,IP40; ComponentLink1URL: http://www.farnell.com/datasheets/60838.pdf?src-supplier=Farnell; ComponentLink1Description: http://www.farnell.com/datasheets/60838.pdf?src-supplier=Farnell; ComponentLink2URL: http://www.farnell.com/datasheets/60838.pdf?src-supplier=Element14; ComponentLink2Description: http://www.farnell.com/datasheets/60838.pdf?src-supplier=Element14; ComponentLink3URL: https://omronfs.omron.com/en_US/ecb/products/pdf/en-b3u.pdf?src-supplier=Digi-Key; ComponentLink3Description: https://omronfs.omron.com/en_US/ecb/products/pdf/en-b3u.pdf?src-supplier=Digi-Key; ComponentLink4URL: http://www.omron.com/ecb/products/pdf/en-b3u.pdf?src-supplier=Digi-Key; ComponentLink4Description: http://www.omron.com/ecb/products/pdf/en-b3u.pdf?src-supplier=Digi-Key; ComponentLink5URL: https://www.distrelec.biz/Web/Downloads/he/et/B3U_eng_datasheet.pdf?mime=application%2Fpdf&src-supplier=Distrelec; ComponentLink5Description: https://www.distrelec.biz/Web/Downloads/he/et/B3U_eng_datasheet.pdf?mime=application%2Fpdf&src-supplier=Distrelec; ComponentLink6URL: http://www.onlinecomponents.com/productFiles/mf-OM/en-b3u.pdf?src-supplier=Onlinecomponents.com; ComponentLink6Description: http://www.onlinecomponents.com/productFiles/mf-OM/en-b3u.pdf?src-supplier=Onlinecomponents.com; Supplier 1: Digi-Key; Manufacturer Part Number: B3U-1000P; Stock 1: 116454; Pricing 1: 1=1, 10=0.961, 25=0.9064, 50=0.7976, 100=0.7251, 250=0.68888, 500=0.67074, 1000=0.52571 (USD); Mount: Surface Mount; Weight: 0.000776oz; Contact Material: Silver; Min Operating Temperature: -25°C; Max Operating Temperature: 70°C; Packaging: Tape and Reel; Voltage Rating (DC): 12V; Package Quantity: 1; Max Current Rating: 50mA; Termination: SMD/SMT; Orientation: Straight; Max Voltage Rating (DC): 12V; Electrical Life: 200000Cycles; Insulation Resistance: 100MR; Contact Current Rating: 50mA; Length: 4mm; Height: 1.2mm; Depth: 2.5mm; Width: 3mm; REACH SVHC: Unknown; Lead Free: Lead Free; ComponentLink7URL: https://www.verical.com/server-webapp/html/getDatasheet?partID=552554&src-supplier=Verical; ComponentLink7Description: https://www.verical.com/server-webapp/html/getDatasheet?partID=552554&src-supplier=Verical; ComponentLink8URL: http://www.farnell.com/datasheets/1685550.pdf?src-supplier=Element14; ComponentLink8Description: http://www.farnell.com/datasheets/1685550.pdf?src-supplier=Element14; ComponentLink9URL: http://www.farnell.com/datasheets/2610940.pdf?src-supplier=Farnell; ComponentLink9Description: http://www.farnell.com/datasheets/2610940.pdf?src-supplier=Farnell; ComponentLink10URL: https://www.alliedelec.com/m/d/4c8a9ef82804fc3c241a13c1e298fd73.pdf?src-supplier=Allied+Electronics; ComponentLink10Description: https://www.alliedelec.com/m/d/4c8a9ef82804fc3c241a13c1e298fd73.pdf?src-supplier=Allied+Electronics; Supplier Part Number 1: SW1020DKR-ND; LCSC Part Number: C231329; Item Type: Switch
TP1 TP10-TP13 TP15 = 2 Test Pad: Wire Connecting Pad; Item Type: Test Point; Manufacturer Part Number: 2 Test Pad
TP14 = TEST POINT: Test Point ON; Item Type: TEST POINT
U4 = MIMXRT1062DVJ6B: IC MCU 32BIT EXT MEM 196LFBGA; Manufacturer: NXP Semiconductors; Supplier: Digi-Key; Supplier Part Number: 568-MIMXRT1062DVJ6B-ND; Manufacturer Part Number: MIMXRT1062DVJ6B; RoHS: Yes; Category: Uncategorized; Stock: 1142; Pricing: 1=15.93, 10=12.734, 189=10.75497, 567=10.68896, 945=10.09187 (USD)
U7 = UM803RS: 3-Pin uP Reset Circuits with Ope; Manufacturer: Union Semiconductor; Item Type: IC; Supplier: Arrow Electronics; Supplier Part Number: UM803RS; Manufacturer Part Number: UM803RS; RoHS: No; Stock: 2840; Pricing: 1=0.1121 (USD); LCSC Part Number: C620009
U14 = M24C64-FDW6TP: IC EEPROM 64KBIT I2C 1MHZ 8TSSOP; Manufacturer: STMicroelectronics; Manufacturer Part Number: M24C64-FDW6TP; Package: TSSOP-8; LCSC Part Number: C222148; Item Type: IC; ComponentLink1Description: LCSC; ComponentLink1URL: https://www.lcsc.com/product-detail/EEPROM_STMicroelectronics-M24C64-FDW6TP_C222148.html; Supplier: Digikey; Supplier Part Number: 497-15760-2-ND; RoHS: Yes; Category: EEPROM; Stock: 12000; Pricing: 4000=0.23401, 8000=0.22895, 12000=0.22493, 28000=0.21957 (USD); ComponentLink2URL: https://datasheet.ciiva.com/26942/getdatasheetpartid-785735-26942181.pdf?src-supplier=Verical; ComponentLink2Description: https://datasheet.ciiva.com/26942/getdatasheetpartid-785735-26942181.pdf?src-supplier=Verical; ComponentLink3URL: https://datasheet.ciiva.com/6617/cd00259166-6617416.pdf?src-supplier=Digikey; ComponentLink3Description: https://datasheet.ciiva.com/6617/cd00259166-6617416.pdf?src-supplier=Digikey
U15 = MKL02Z32VFG4: IC MCU 32BIT 32KB FLASH 16QFN; Manufacturer: NXP USA; Supplier: Newark; Supplier Part Number: 49X9712; Manufacturer Part Number: MKL02Z32VFG4; RoHS: No
U20 = W25Q64JVSSIM: IC FLASH 64MBIT SPI/QUAD 8SOIC; Manufacturer: Winbond; Memory Format: Non-Volatile,FLASH; Memory Size: 64Mb; Frequency: 133MHz; Supplier: Rs; Supplier Part Number: 1882666P; Manufacturer Part Number: W25Q64JVSSIM; RoHS: Yes; Category: Flash; Stock: 300; Pricing: 20=0.818, 50=0.796, 100=0.776, 250=0.756 (GBP); Mounting Technology: Surface Mount; Case/Package: SOIC; Min Operating Temperature: -40°C; Max Operating Temperature: 85°C; Packaging: Rail/Tube; Series: SpiFlash®; RoHS Compliant: Yes; ComponentLink1URL: http://www.winbond.com/resource-files/w25q64jv%20revj%2003272018%20plus.pdf?src-supplier=Digi-Key; ComponentLink1Description: http://www.winbond.com/resource-files/w25q64jv%20revj%2003272018%20plus.pdf?src-supplier=Digi-Key; LCSC Part Number: C5362615; Item Type: IC
X1 = X322524MOB4SI: 24MHz SMD Crystal Resonator 12pF ±10ppm ±30ppm -40℃~+85℃ SMD3225-4P Crystals ROHS; Manufacturer: Yangxing Tech; ComponentLink1Description: LCSC; ComponentLink1URL: https://www.lcsc.com/product-detail/Crystals_Yangxing-Tech-X322524MOB4SI_C70590.html; Manufacturer Part Number: X322524MOB4SI; Footprint: Custom; LCSC Part Number: C70590; Item Type: Crystal
X4 = NX3215SA-32.768K-STD-MUA-8: CRYSTAL 32.7680KHZ 12.5PF SMD; Manufacturer: NDK; Frequency: 32.768kHz; Frequency Tolerance: 20ppm; ESR (Equivalent Series Resistance): 70kR; Supplier 1: Digi-Key; Manufacturer Part Number: NX3215SA-32.768K-STD-MUA-8; Stock 1: 29951; Pricing 1: 1=0.68, 10=0.602, 50=0.5628, 100=0.4974, 500=0.47124, 1000=0.3927 (USD); Mount: Surface Mount; Case/Package: SMD/SMT; Number of Pins: 2; Min Operating Temperature: -40°C; Max Operating Temperature: 85°C; Package Quantity: 1000; Load Capacitance: 12.5pF; Packaging: Tape and Reel; Length: 0.126inch; Height: 0.035inch; Width: 0.059inch; Lead Free: Lead Free; ComponentLink1URL: https://media.digikey.com/pdf/Data%20Sheets/NDK%20PDFs/NX3215SA-32.768K-STD-MUA-8.pdf?src-supplier=Digi-Key; ComponentLink1Description: https://media.digikey.com/pdf/Data%20Sheets/NDK%20PDFs/NX3215SA-32.768K-STD-MUA-8.pdf?src-supplier=Digi-Key; ComponentLink2URL: http://www.ndk.com/images/products/catalog/c_NX3215SA-STD-MUA-14_e.pdf?src-supplier=Digi-Key; ComponentLink2Description: http://www.ndk.com/images/products/catalog/c_NX3215SA-STD-MUA-14_e.pdf?src-supplier=Digi-Key; Supplier Part Number 1: 644-1156-6-ND; LCSC Part Number: C156245